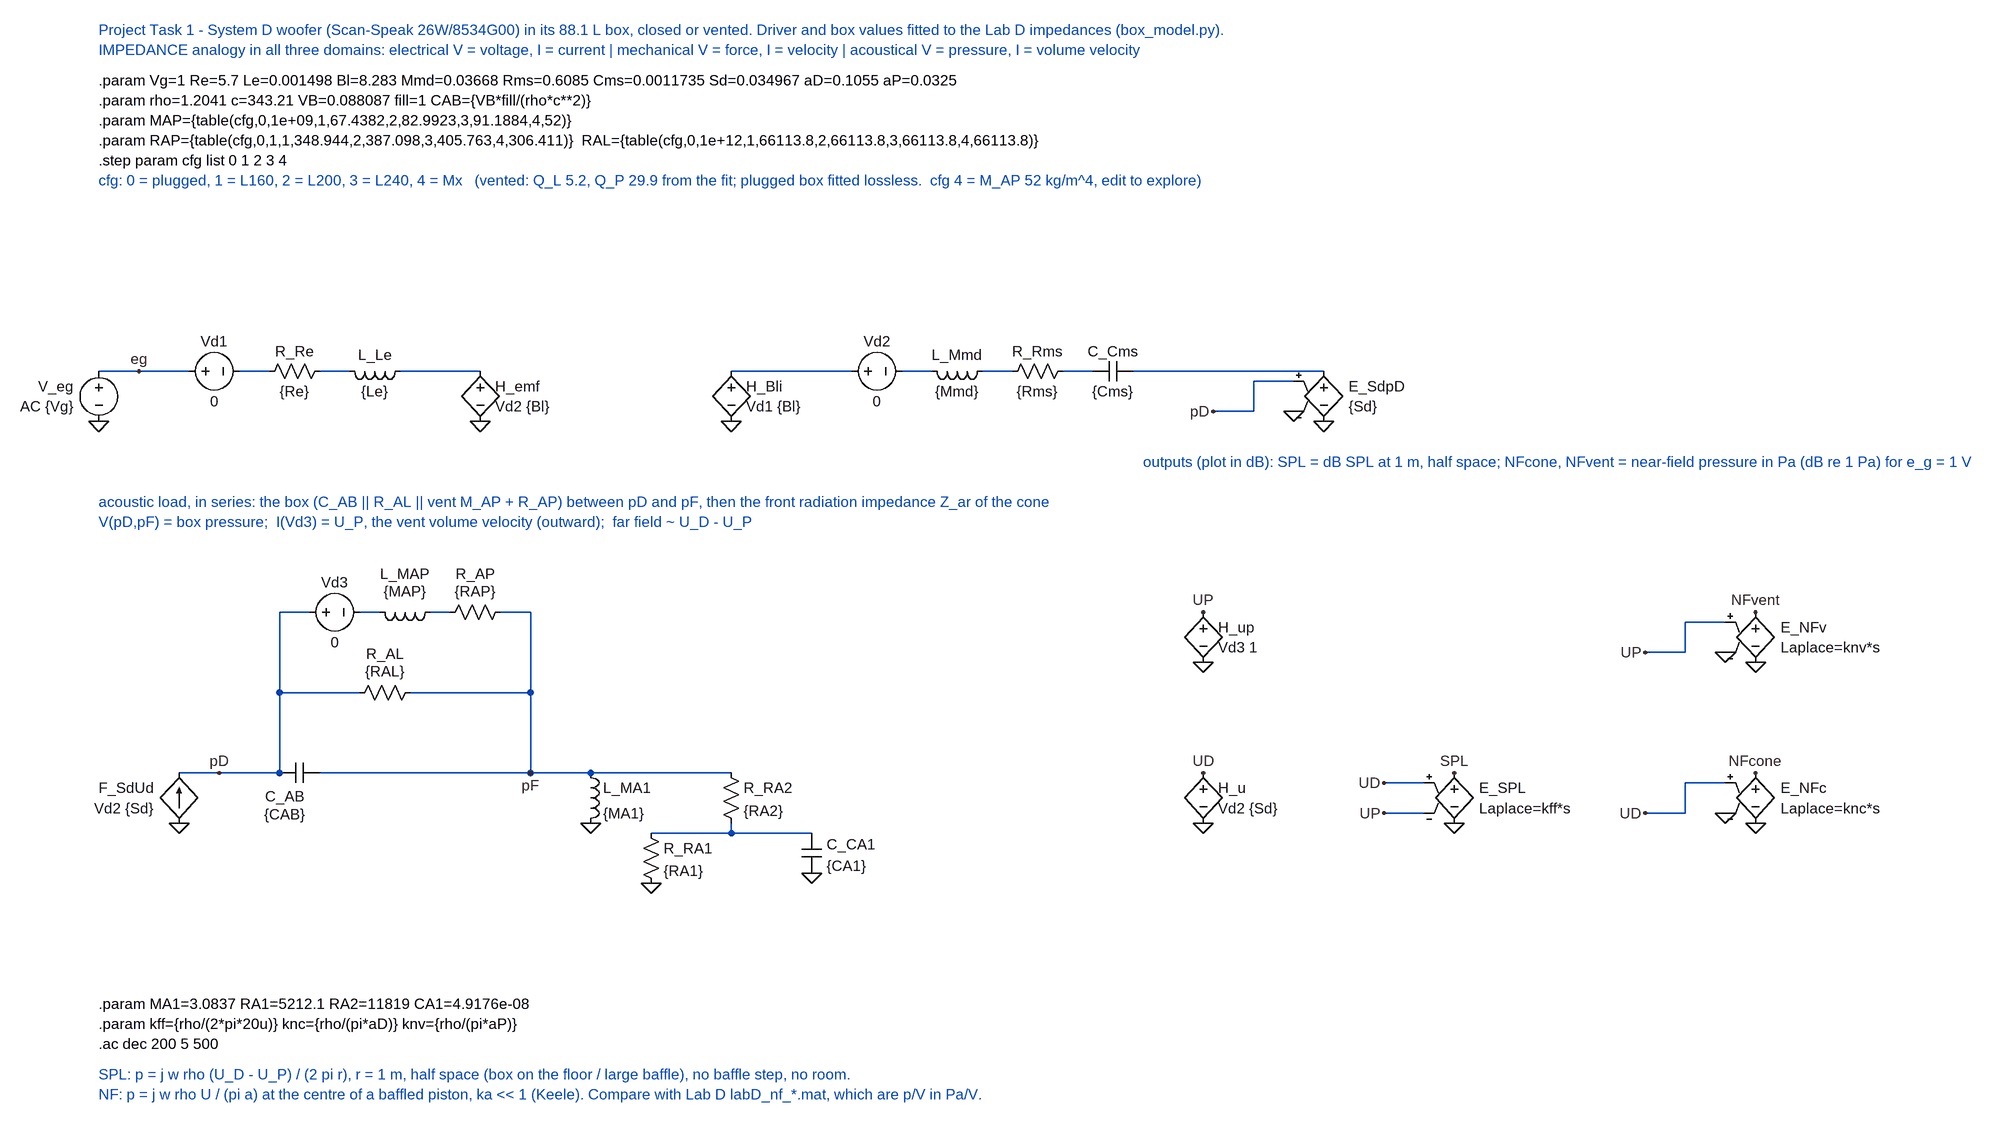
[diagram p0: schematic Task1_WooferBox.asc]
Task1_WooferBox.asc, the LTspice schematic file:
Version 4
SHEET 1 3000 1600
WIRE 0 0 144 0
WIRE 224 0 272 0
WIRE 352 0 400 0
WIRE 480 0 608 0
WIRE 1008 0 1200 0
WIRE 1280 0 1328 0
WIRE 1408 0 1456 0
WIRE 1536 0 1584 0
WIRE 1648 0 1952 0
WIRE 1904 16 1840 16
WIRE 1840 16 1840 64
WIRE 1840 64 1776 64
WIRE 128 640 288 640
WIRE 352 640 688 640
WIRE 288 640 288 512
WIRE 288 512 416 512
WIRE 496 512 688 512
WIRE 688 512 688 640
WIRE 288 512 288 384
WIRE 288 384 336 384
WIRE 416 384 448 384
WIRE 528 384 560 384
WIRE 640 384 688 384
WIRE 688 384 688 512
WIRE 688 640 784 640
WIRE 784 640 1008 640
WIRE 1008 720 1008 736
WIRE 880 736 1136 736
WIRE 2112 656 2048 656
WIRE 2112 704 2048 704
WIRE 2592 656 2528 656
WIRE 2528 656 2528 704
WIRE 2528 704 2464 704
WIRE 2592 400 2528 400
WIRE 2528 400 2528 448
WIRE 2528 448 2464 448
FLAG 0 80 0
FLAG 64 0 eg
FLAG 608 80 0
FLAG 1008 80 0
FLAG 1952 80 0
FLAG 1904 64 0
FLAG 1776 64 pD
FLAG 128 720 0
FLAG 192 640 pD
FLAG 688 640 pF
FLAG 784 720 0
FLAG 880 816 0
FLAG 1136 800 0
FLAG 1760 720 0
FLAG 1760 640 UD
FLAG 1760 464 0
FLAG 1760 384 UP
FLAG 2160 720 0
FLAG 2160 640 SPL
FLAG 2048 656 UD
FLAG 2048 704 UP
FLAG 2640 720 0
FLAG 2592 704 0
FLAG 2464 704 UD
FLAG 2640 640 NFcone
FLAG 2640 464 0
FLAG 2592 448 0
FLAG 2464 448 UP
FLAG 2640 384 NFvent
SYMBOL voltage 0 -16 R0
WINDOW 0 -40 40 Right 2
WINDOW 3 -40 72 Right 2
SYMATTR InstName V_eg
SYMATTR Value AC {Vg}
SYMBOL voltage 128 0 R270
WINDOW 0 32 56 VTop 2
WINDOW 3 -32 56 VBottom 2
SYMATTR InstName Vd1
SYMATTR Value 0
SYMBOL res 368 -16 R90
WINDOW 0 0 56 VBottom 2
WINDOW 3 32 56 VTop 2
SYMATTR InstName R_Re
SYMATTR Value {Re}
SYMBOL ind 496 -16 R90
WINDOW 0 5 56 VBottom 2
WINDOW 3 32 56 VTop 2
SYMATTR InstName L_Le
SYMATTR Value {Le}
SYMATTR SpiceLine Rser=0
SYMBOL h 608 -16 R0
WINDOW 0 24 40 Left 2
WINDOW 3 24 72 Left 2
SYMATTR InstName H_emf
SYMATTR Value Vd2 {Bl}
SYMBOL h 1008 -16 R0
WINDOW 0 24 40 Left 2
WINDOW 3 24 72 Left 2
SYMATTR InstName H_Bli
SYMATTR Value Vd1 {Bl}
SYMBOL voltage 1184 0 R270
WINDOW 0 32 56 VTop 2
WINDOW 3 -32 56 VBottom 2
SYMATTR InstName Vd2
SYMATTR Value 0
SYMBOL ind 1424 -16 R90
WINDOW 0 5 56 VBottom 2
WINDOW 3 32 56 VTop 2
SYMATTR InstName L_Mmd
SYMATTR Value {Mmd}
SYMATTR SpiceLine Rser=0
SYMBOL res 1552 -16 R90
WINDOW 0 0 56 VBottom 2
WINDOW 3 32 56 VTop 2
SYMATTR InstName R_Rms
SYMATTR Value {Rms}
SYMBOL cap 1648 -16 R90
WINDOW 0 0 32 VBottom 2
WINDOW 3 32 32 VTop 2
SYMATTR InstName C_Cms
SYMATTR Value {Cms}
SYMBOL e 1952 -16 R0
WINDOW 0 40 40 Left 2
WINDOW 3 40 72 Left 2
SYMATTR InstName E_SdpD
SYMATTR Value {Sd}
SYMBOL f 128 720 R180
WINDOW 0 40 56 Left 2
WINDOW 3 40 24 Left 2
SYMATTR InstName F_SdUd
SYMATTR Value Vd2 {Sd}
SYMBOL cap 352 624 R90
WINDOW 0 38 56 VTop 2
WINDOW 3 66 56 VTop 2
SYMATTR InstName C_AB
SYMATTR Value {CAB}
SYMBOL res 512 496 R90
WINDOW 0 -30 56 VBottom 2
WINDOW 3 -2 56 VBottom 2
SYMATTR InstName R_AL
SYMATTR Value {RAL}
SYMBOL voltage 320 384 R270
WINDOW 0 32 56 VTop 2
WINDOW 3 -32 56 VBottom 2
SYMATTR InstName Vd3
SYMATTR Value 0
SYMBOL ind 544 368 R90
WINDOW 0 -30 56 VBottom 2
WINDOW 3 -2 56 VBottom 2
SYMATTR InstName L_MAP
SYMATTR Value {MAP}
SYMATTR SpiceLine Rser=0
SYMBOL res 656 368 R90
WINDOW 0 -30 56 VBottom 2
WINDOW 3 -2 56 VBottom 2
SYMATTR InstName R_AP
SYMATTR Value {RAP}
SYMBOL ind 768 624 R0
SYMATTR InstName L_MA1
SYMATTR Value {MA1}
SYMATTR SpiceLine Rser=0
SYMBOL res 992 624 R0
SYMATTR InstName R_RA2
SYMATTR Value {RA2}
SYMBOL res 864 720 R0
SYMATTR InstName R_RA1
SYMATTR Value {RA1}
SYMBOL cap 1120 736 R0
WINDOW 0 40 18 Left 2
WINDOW 3 40 52 Left 2
SYMATTR InstName C_CA1
SYMATTR Value {CA1}
SYMBOL h 1760 624 R0
WINDOW 0 24 40 Left 2
WINDOW 3 24 72 Left 2
SYMATTR InstName H_u
SYMATTR Value Vd2 {Sd}
SYMBOL h 1760 368 R0
WINDOW 0 24 40 Left 2
WINDOW 3 24 72 Left 2
SYMATTR InstName H_up
SYMATTR Value Vd3 1
SYMBOL e 2160 624 R0
WINDOW 0 40 40 Left 2
WINDOW 3 40 72 Left 2
SYMATTR InstName E_SPL
SYMATTR Value Laplace=kff*s
SYMBOL e 2640 624 R0
WINDOW 0 40 40 Left 2
WINDOW 3 40 72 Left 2
SYMATTR InstName E_NFc
SYMATTR Value Laplace=knc*s
SYMBOL e 2640 368 R0
WINDOW 0 40 40 Left 2
WINDOW 3 40 72 Left 2
SYMATTR InstName E_NFv
SYMATTR Value Laplace=knv*s
TEXT 0 -544 Left 2 ;Project Task 1 - System D woofer (Scan-Speak 26W/8534G00) in its 88.1 L box, closed or vented. Driver and box values fitted to the Lab D impedances (box_model.py).
TEXT 0 -512 Left 2 ;IMPEDANCE analogy in all three domains: electrical V = voltage, I = current | mechanical V = force, I = velocity | acoustical V = pressure, I = volume velocity
TEXT 0 -464 Left 2 !.param Vg=1 Re=5.7 Le=0.001498 Bl=8.283 Mmd=0.03668 Rms=0.6085 Cms=0.0011735 Sd=0.034967 aD=0.1055 aP=0.0325
TEXT 0 -432 Left 2 !.param rho=1.2041 c=343.21 VB=0.088087 fill=1 CAB={VB*fill/(rho*c**2)}
TEXT 0 -400 Left 2 !.param MAP={table(cfg,0,1e+09,1,67.4382,2,82.9923,3,91.1884,4,52)}
TEXT 0 -368 Left 2 !.param RAP={table(cfg,0,1,1,348.944,2,387.098,3,405.763,4,306.411)}  RAL={table(cfg,0,1e+12,1,66113.8,2,66113.8,3,66113.8,4,66113.8)}
TEXT 0 -336 Left 2 !.step param cfg list 0 1 2 3 4
TEXT 0 -304 Left 2 ;cfg: 0 = plugged, 1 = L160, 2 = L200, 3 = L240, 4 = Mx   (vented: Q_L 5.2, Q_P 29.9 from the fit; plugged box fitted lossless.  cfg 4 = M_AP 52 kg/m^4, edit to explore)
TEXT 0 208 Left 2 ;acoustic load, in series: the box (C_AB || R_AL || vent M_AP + R_AP) between pD and pF, then the front radiation impedance Z_ar of the cone
TEXT 0 240 Left 2 ;V(pD,pF) = box pressure;  I(Vd3) = U_P, the vent volume velocity (outward);  far field ~ U_D - U_P
TEXT 0 1008 Left 2 !.param MA1=3.0837 RA1=5212.1 RA2=11819 CA1=4.9176e-08
TEXT 1664 144 Left 2 ;outputs (plot in dB): SPL = dB SPL at 1 m, half space; NFcone, NFvent = near-field pressure in Pa (dB re 1 Pa) for e_g = 1 V
TEXT 0 1040 Left 2 !.param kff={rho/(2*pi*20u)} knc={rho/(pi*aD)} knv={rho/(pi*aP)}
TEXT 0 1072 Left 2 !.ac dec 200 5 500
TEXT 0 1120 Left 2 ;SPL: p = j w rho (U_D - U_P) / (2 pi r), r = 1 m, half space (box on the floor / large baffle), no baffle step, no room.
TEXT 0 1152 Left 2 ;NF: p = j w rho U / (pi a) at the centre of a baffled piston, ka << 1 (Keele). Compare with Lab D labD_nf_*.mat, which are p/V in Pa/V.

The netlist it stands for:
* Task1_WooferBox.asc
V_eg eg 0 AC {Vg}
Vd1 eg N001 0
R_Re N002 N001 {Re}
L_Le N003 N002 {Le} Rser=0
H_emf N003 0 Vd2 {Bl}
H_Bli N004 0 Vd1 {Bl}
Vd2 N004 N005 0
L_Mmd N006 N005 {Mmd} Rser=0
R_Rms N007 N006 {Rms}
C_Cms N008 N007 {Cms}
E_SdpD N008 0 pD 0 {Sd}
F_SdUd 0 pD Vd2 {Sd}
C_AB pF pD {CAB}
R_AL pF pD {RAL}
Vd3 pD N009 0
L_MAP N010 N009 {MAP} Rser=0
R_AP pF N010 {RAP}
L_MA1 pF 0 {MA1} Rser=0
R_RA2 pF N011 {RA2}
R_RA1 N011 0 {RA1}
C_CA1 N011 0 {CA1}
H_u UD 0 Vd2 {Sd}
H_up UP 0 Vd3 1
E_SPL SPL 0 UD UP Laplace=kff*s
E_NFc NFcone 0 UD 0 Laplace=knc*s
E_NFv NFvent 0 UP 0 Laplace=knv*s
* Project Task 1 - System D woofer (Scan-Speak 26W/8534G00) in its 88.1 L box, closed or vented. Driver and box values fitted to the Lab D impedances (box_model.py).
* IMPEDANCE analogy in all three domains: electrical V = voltage, I = current | mechanical V = force, I = velocity | acoustical V = pressure, I = volume velocity
.param Vg=1 Re=5.7 Le=0.001498 Bl=8.283 Mmd=0.03668 Rms=0.6085 Cms=0.0011735 Sd=0.034967 aD=0.1055 aP=0.0325
.param rho=1.2041 c=343.21 VB=0.088087 fill=1 CAB={VB*fill/(rho*c**2)}
.param MAP={table(cfg,0,1e+09,1,67.4382,2,82.9923,3,91.1884,4,52)}
.param RAP={table(cfg,0,1,1,348.944,2,387.098,3,405.763,4,306.411)}  RAL={table(cfg,0,1e+12,1,66113.8,2,66113.8,3,66113.8,4,66113.8)}
.step param cfg list 0 1 2 3 4
* cfg: 0 = plugged, 1 = L160, 2 = L200, 3 = L240, 4 = Mx   (vented: Q_L 5.2, Q_P 29.9 from the fit; plugged box fitted lossless.  cfg 4 = M_AP 52 kg/m^4, edit to explore)
* acoustic load, in series: the box (C_AB || R_AL || vent M_AP + R_AP) between pD and pF, then the front radiation impedance Z_ar of the cone
* V(pD,pF) = box pressure;  I(Vd3) = U_P, the vent volume velocity (outward);  far field ~ U_D - U_P
.param MA1=3.0837 RA1=5212.1 RA2=11819 CA1=4.9176e-08
* outputs (plot in dB): SPL = dB SPL at 1 m, half space; NFcone, NFvent = near-field pressure in Pa (dB re 1 Pa) for e_g = 1 V
.param kff={rho/(2*pi*20u)} knc={rho/(pi*aD)} knv={rho/(pi*aP)}
.ac dec 200 5 500
* SPL: p = j w rho (U_D - U_P) / (2 pi r), r = 1 m, half space (box on the floor / large baffle), no baffle step, no room.
* NF: p = j w rho U / (pi a) at the centre of a baffled piston, ka << 1 (Keele). Compare with Lab D labD_nf_*.mat, which are p/V in Pa/V.
.backanno
.end